# Altium schematic sheet SPSU_4.SchDoc: SPSU
size 292 x 217 mm; PCB_VERSION: V3.0; Origin: Eagle; Date: 12/02/2024 2:33:38 pm; SheetNumber: 5; SCHEMATIC_VERSION: SCHEMATIC_VERSION; GateName_1: G$1; SymbolName_1: A4L-LOC; LibraryName: frames_corvus; DeviceSetName: A4L-LOC; Sheet: Sheet:
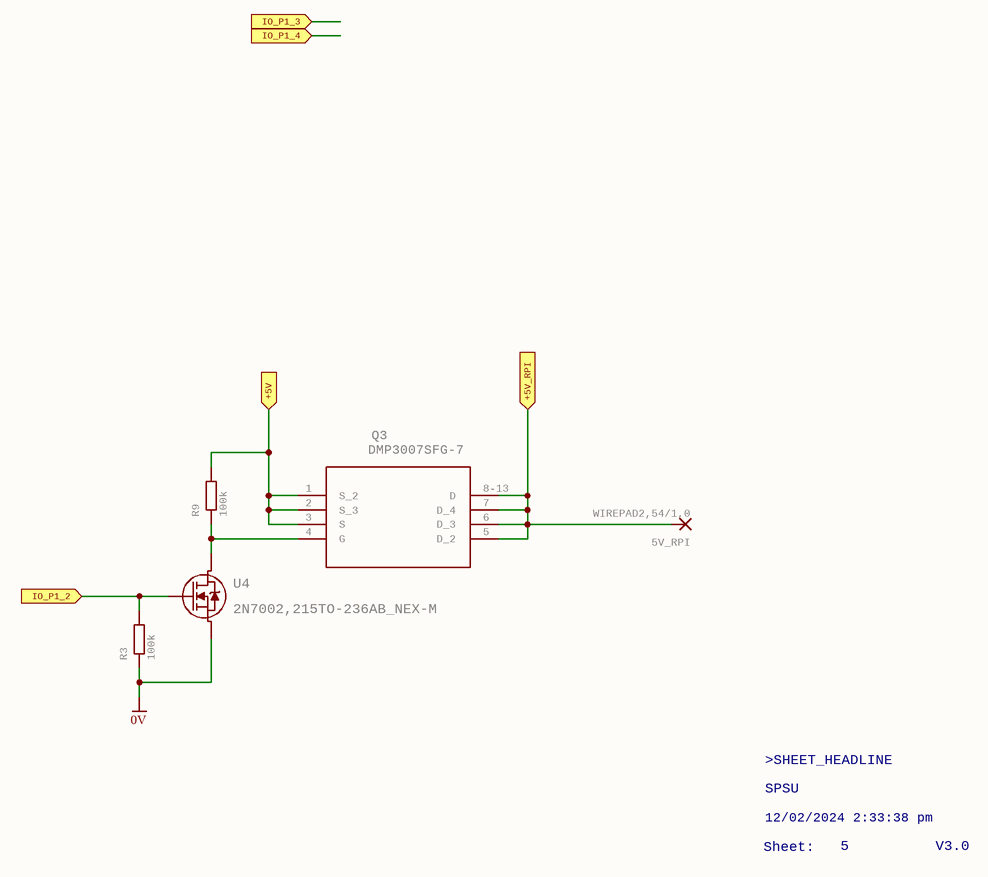
[diagram p0: SPSU_4.SchDoc]

## Parts
5V_RPI  WIREPAD2,54/1,0  [2,54/1,0]
Q3  DMP3007SFG-7  [POWERDI3333-8_3P3X3P3_DIO]
R3  100k  [R0603]
R9  100k  [R0603]
U4  2N7002,215TO-236AB_NEX-M  [TO-236AB_NEX-M]

## Ports
+5V (in), +5V_RPI (in), IO_P1_2 (in), IO_P1_3 (in), IO_P1_4 (in)

## Nets
0V: R3.1 U4.2
+5V: Q3.1(S_2) Q3.2(S_3) Q3.3(S) R9.2 ; port +5V
+5V_RPI: 5V_RPI.1(P) Q3.5(D_2) Q3.6(D_3) Q3.7(D_4) Q3.8-13(D) ; port +5V_RPI
IO_P1_2: R3.2 U4.1 ; port IO_P1_2
NetQ3_4: Q3.4(G) R9.1 U4.3

## Notes on the sheet
- >SHEET_HEADLINE
- Sheet:
- SPSU
- 12/02/2024 2:33:38 pm
- 5
- V3.0

## Library data of the parts
5V_RPI = WIREPAD2,54/1,0: Wire PAD connect wire on PCB; GateName_1: G$1; POPULARITY: 4; SymbolName_1: PAD; DeviceName: 2,54/1,0; LibraryName: wirepad; DeviceSetName: WIREPAD
Q3 = DMP3007SFG-7: MFR_NAME: Diodes Inc; GateName_1: A; SymbolName_1: DMP3007SFG-7; LibraryName: Mosfets; DeviceSetName: DMP3007SFG-7; COPYRIGHT: Copyright (C) 2022 Ultra Librarian. All rights reserved.; MANUFACTURER_PART_NUMBER: DMP3007SFG-7
R3 R9 = R_0603: GateName_1: >R_NAME$1; SymbolName_1: R-EU; LibraryName: corvus_RC; DeviceSetName: R_0603; FARNELL: 2447226
U4 = 2N7002,215TO-236AB_NEX-M: MFR_NAME: Nexperia; GateName_1: A; SymbolName_1: TRANS_S; DeviceName: TO-236AB_NEX-M; LibraryName: 2n7002; DeviceSetName: 2N7002,215; COPYRIGHT: Copyright (C) 2022 Ultra Librarian. All rights reserved.; MANUFACTURER_PART_NUMBER: 2N7002,215